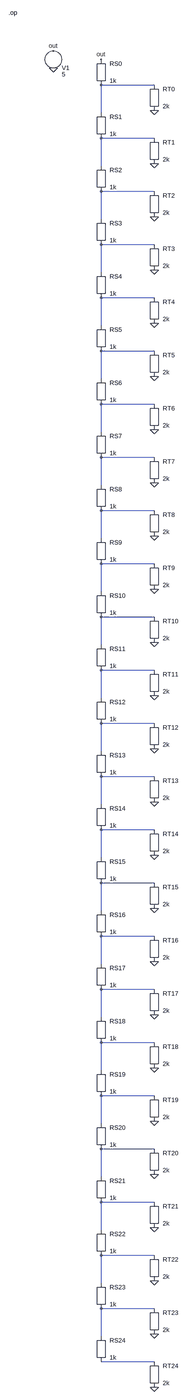
[diagram p0: schematic r2r_ladder_labelled.asc, whole sheet]
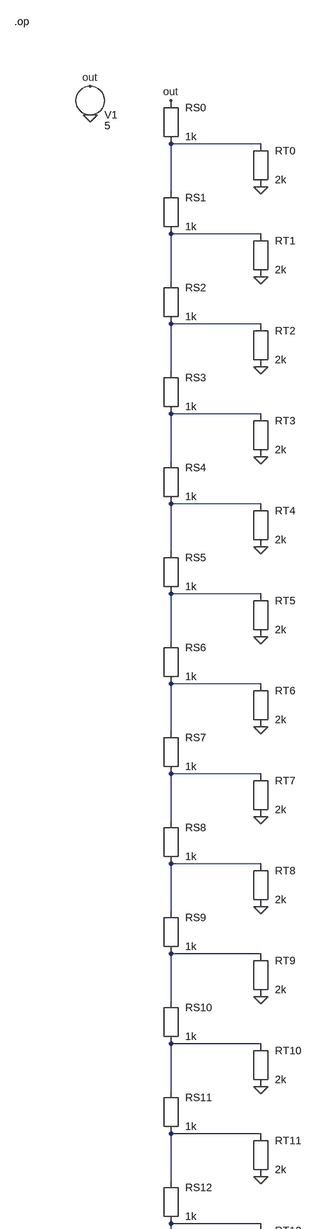
[diagram p1: schematic r2r_ladder_labelled.asc, part, row 1 of 2, column 1 of 1]
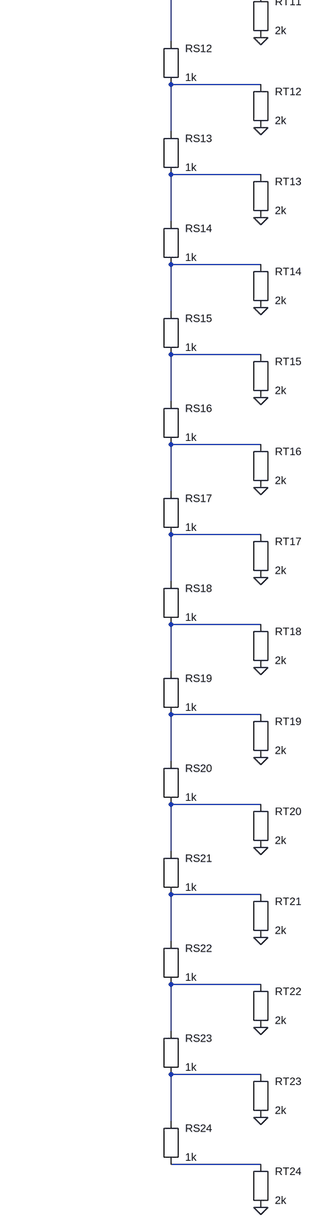
[diagram p2: schematic r2r_ladder_labelled.asc, part, row 2 of 2, column 1 of 1]
r2r_ladder_labelled.asc, the LTspice schematic file:
Version 4
SHEET 1 880 680
WIRE 400 348 400 452
WIRE 400 548 400 652
WIRE 400 748 400 852
WIRE 400 948 400 1052
WIRE 400 1148 400 1252
WIRE 400 1348 400 1452
WIRE 400 1548 400 1652
WIRE 400 1748 400 1852
WIRE 400 1948 400 2052
WIRE 400 2148 400 2252
WIRE 400 2348 400 2452
WIRE 400 2548 400 2652
WIRE 400 2748 400 2852
WIRE 400 2948 400 3052
WIRE 400 3148 400 3252
WIRE 400 3348 400 3452
WIRE 400 3548 400 3652
WIRE 400 3748 400 3852
WIRE 400 3948 400 4052
WIRE 400 4148 400 4252
WIRE 400 4348 400 4452
WIRE 400 4548 400 4652
WIRE 400 4748 400 4852
WIRE 400 4948 400 5052
WIRE 600 348 400 348
WIRE 600 548 400 548
WIRE 600 748 400 748
WIRE 600 948 400 948
WIRE 600 1148 400 1148
WIRE 600 1348 400 1348
WIRE 600 1548 400 1548
WIRE 600 1748 400 1748
WIRE 600 1948 400 1948
WIRE 600 2148 400 2148
WIRE 600 2348 400 2348
WIRE 600 2548 400 2548
WIRE 600 2748 400 2748
WIRE 600 2948 400 2948
WIRE 600 3148 400 3148
WIRE 600 3348 400 3348
WIRE 600 3548 400 3548
WIRE 600 3748 400 3748
WIRE 600 3948 400 3948
WIRE 600 4148 400 4148
WIRE 600 4348 400 4348
WIRE 600 4548 400 4548
WIRE 600 4748 400 4748
WIRE 600 4948 400 4948
WIRE 600 5148 400 5148
FLAG 400 252 out
FLAG 600 444 0
FLAG 600 644 0
FLAG 600 844 0
FLAG 600 1044 0
FLAG 600 1244 0
FLAG 600 1444 0
FLAG 600 1644 0
FLAG 600 1844 0
FLAG 600 2044 0
FLAG 600 2244 0
FLAG 600 2444 0
FLAG 600 2644 0
FLAG 600 2844 0
FLAG 600 3044 0
FLAG 600 3244 0
FLAG 600 3444 0
FLAG 600 3644 0
FLAG 600 3844 0
FLAG 600 4044 0
FLAG 600 4244 0
FLAG 600 4444 0
FLAG 600 4644 0
FLAG 600 4844 0
FLAG 600 5044 0
FLAG 600 5244 0
FLAG 200 220 out
FLAG 200 284 0
SYMBOL res 400 300 R0
SYMATTR InstName RS0
SYMATTR Value 1k
SYMBOL res 600 396 R0
SYMATTR InstName RT0
SYMATTR Value 2k
SYMBOL res 400 500 R0
SYMATTR InstName RS1
SYMATTR Value 1k
SYMBOL res 600 596 R0
SYMATTR InstName RT1
SYMATTR Value 2k
SYMBOL res 400 700 R0
SYMATTR InstName RS2
SYMATTR Value 1k
SYMBOL res 600 796 R0
SYMATTR InstName RT2
SYMATTR Value 2k
SYMBOL res 400 900 R0
SYMATTR InstName RS3
SYMATTR Value 1k
SYMBOL res 600 996 R0
SYMATTR InstName RT3
SYMATTR Value 2k
SYMBOL res 400 1100 R0
SYMATTR InstName RS4
SYMATTR Value 1k
SYMBOL res 600 1196 R0
SYMATTR InstName RT4
SYMATTR Value 2k
SYMBOL res 400 1300 R0
SYMATTR InstName RS5
SYMATTR Value 1k
SYMBOL res 600 1396 R0
SYMATTR InstName RT5
SYMATTR Value 2k
SYMBOL res 400 1500 R0
SYMATTR InstName RS6
SYMATTR Value 1k
SYMBOL res 600 1596 R0
SYMATTR InstName RT6
SYMATTR Value 2k
SYMBOL res 400 1700 R0
SYMATTR InstName RS7
SYMATTR Value 1k
SYMBOL res 600 1796 R0
SYMATTR InstName RT7
SYMATTR Value 2k
SYMBOL res 400 1900 R0
SYMATTR InstName RS8
SYMATTR Value 1k
SYMBOL res 600 1996 R0
SYMATTR InstName RT8
SYMATTR Value 2k
SYMBOL res 400 2100 R0
SYMATTR InstName RS9
SYMATTR Value 1k
SYMBOL res 600 2196 R0
SYMATTR InstName RT9
SYMATTR Value 2k
SYMBOL res 400 2300 R0
SYMATTR InstName RS10
SYMATTR Value 1k
SYMBOL res 600 2396 R0
SYMATTR InstName RT10
SYMATTR Value 2k
SYMBOL res 400 2500 R0
SYMATTR InstName RS11
SYMATTR Value 1k
SYMBOL res 600 2596 R0
SYMATTR InstName RT11
SYMATTR Value 2k
SYMBOL res 400 2700 R0
SYMATTR InstName RS12
SYMATTR Value 1k
SYMBOL res 600 2796 R0
SYMATTR InstName RT12
SYMATTR Value 2k
SYMBOL res 400 2900 R0
SYMATTR InstName RS13
SYMATTR Value 1k
SYMBOL res 600 2996 R0
SYMATTR InstName RT13
SYMATTR Value 2k
SYMBOL res 400 3100 R0
SYMATTR InstName RS14
SYMATTR Value 1k
SYMBOL res 600 3196 R0
SYMATTR InstName RT14
SYMATTR Value 2k
SYMBOL res 400 3300 R0
SYMATTR InstName RS15
SYMATTR Value 1k
SYMBOL res 600 3396 R0
SYMATTR InstName RT15
SYMATTR Value 2k
SYMBOL res 400 3500 R0
SYMATTR InstName RS16
SYMATTR Value 1k
SYMBOL res 600 3596 R0
SYMATTR InstName RT16
SYMATTR Value 2k
SYMBOL res 400 3700 R0
SYMATTR InstName RS17
SYMATTR Value 1k
SYMBOL res 600 3796 R0
SYMATTR InstName RT17
SYMATTR Value 2k
SYMBOL res 400 3900 R0
SYMATTR InstName RS18
SYMATTR Value 1k
SYMBOL res 600 3996 R0
SYMATTR InstName RT18
SYMATTR Value 2k
SYMBOL res 400 4100 R0
SYMATTR InstName RS19
SYMATTR Value 1k
SYMBOL res 600 4196 R0
SYMATTR InstName RT19
SYMATTR Value 2k
SYMBOL res 400 4300 R0
SYMATTR InstName RS20
SYMATTR Value 1k
SYMBOL res 600 4396 R0
SYMATTR InstName RT20
SYMATTR Value 2k
SYMBOL res 400 4500 R0
SYMATTR InstName RS21
SYMATTR Value 1k
SYMBOL res 600 4596 R0
SYMATTR InstName RT21
SYMATTR Value 2k
SYMBOL res 400 4700 R0
SYMATTR InstName RS22
SYMATTR Value 1k
SYMBOL res 600 4796 R0
SYMATTR InstName RT22
SYMATTR Value 2k
SYMBOL res 400 4900 R0
SYMATTR InstName RS23
SYMATTR Value 1k
SYMBOL res 600 4996 R0
SYMATTR InstName RT23
SYMATTR Value 2k
SYMBOL res 400 5100 R0
SYMATTR InstName RS24
SYMATTR Value 1k
SYMBOL res 600 5196 R0
SYMATTR InstName RT24
SYMATTR Value 2k
SYMBOL voltage 200 252 R0
SYMATTR InstName V1
SYMATTR Value 5
TEXT 16 16 Left 2 !.op

The netlist it stands for:
* r2r_ladder_labelled.asc
RS0 out N001 1k
RT0 N001 0 2k
RS1 N001 N002 1k
RT1 N002 0 2k
RS2 N002 N003 1k
RT2 N003 0 2k
RS3 N003 N004 1k
RT3 N004 0 2k
RS4 N004 N005 1k
RT4 N005 0 2k
RS5 N005 N006 1k
RT5 N006 0 2k
RS6 N006 N007 1k
RT6 N007 0 2k
RS7 N007 N008 1k
RT7 N008 0 2k
RS8 N008 N009 1k
RT8 N009 0 2k
RS9 N009 N010 1k
RT9 N010 0 2k
RS10 N010 N011 1k
RT10 N011 0 2k
RS11 N011 N012 1k
RT11 N012 0 2k
RS12 N012 N013 1k
RT12 N013 0 2k
RS13 N013 N014 1k
RT13 N014 0 2k
RS14 N014 N015 1k
RT14 N015 0 2k
RS15 N015 N016 1k
RT15 N016 0 2k
RS16 N016 N017 1k
RT16 N017 0 2k
RS17 N017 N018 1k
RT17 N018 0 2k
RS18 N018 N019 1k
RT18 N019 0 2k
RS19 N019 N020 1k
RT19 N020 0 2k
RS20 N020 N021 1k
RT20 N021 0 2k
RS21 N021 N022 1k
RT21 N022 0 2k
RS22 N022 N023 1k
RT22 N023 0 2k
RS23 N023 N024 1k
RT23 N024 0 2k
RS24 N024 N025 1k
RT24 N025 0 2k
V1 out 0 5
.op
.backanno
.end